# Altium project Mega2560_Custom.PrjPcb (part 4 of 4)

## Sheet SDCard-Sheet.SchDoc
size A4; DocumentNumber: 8; SheetNumber: 8; SheetTotal: 8
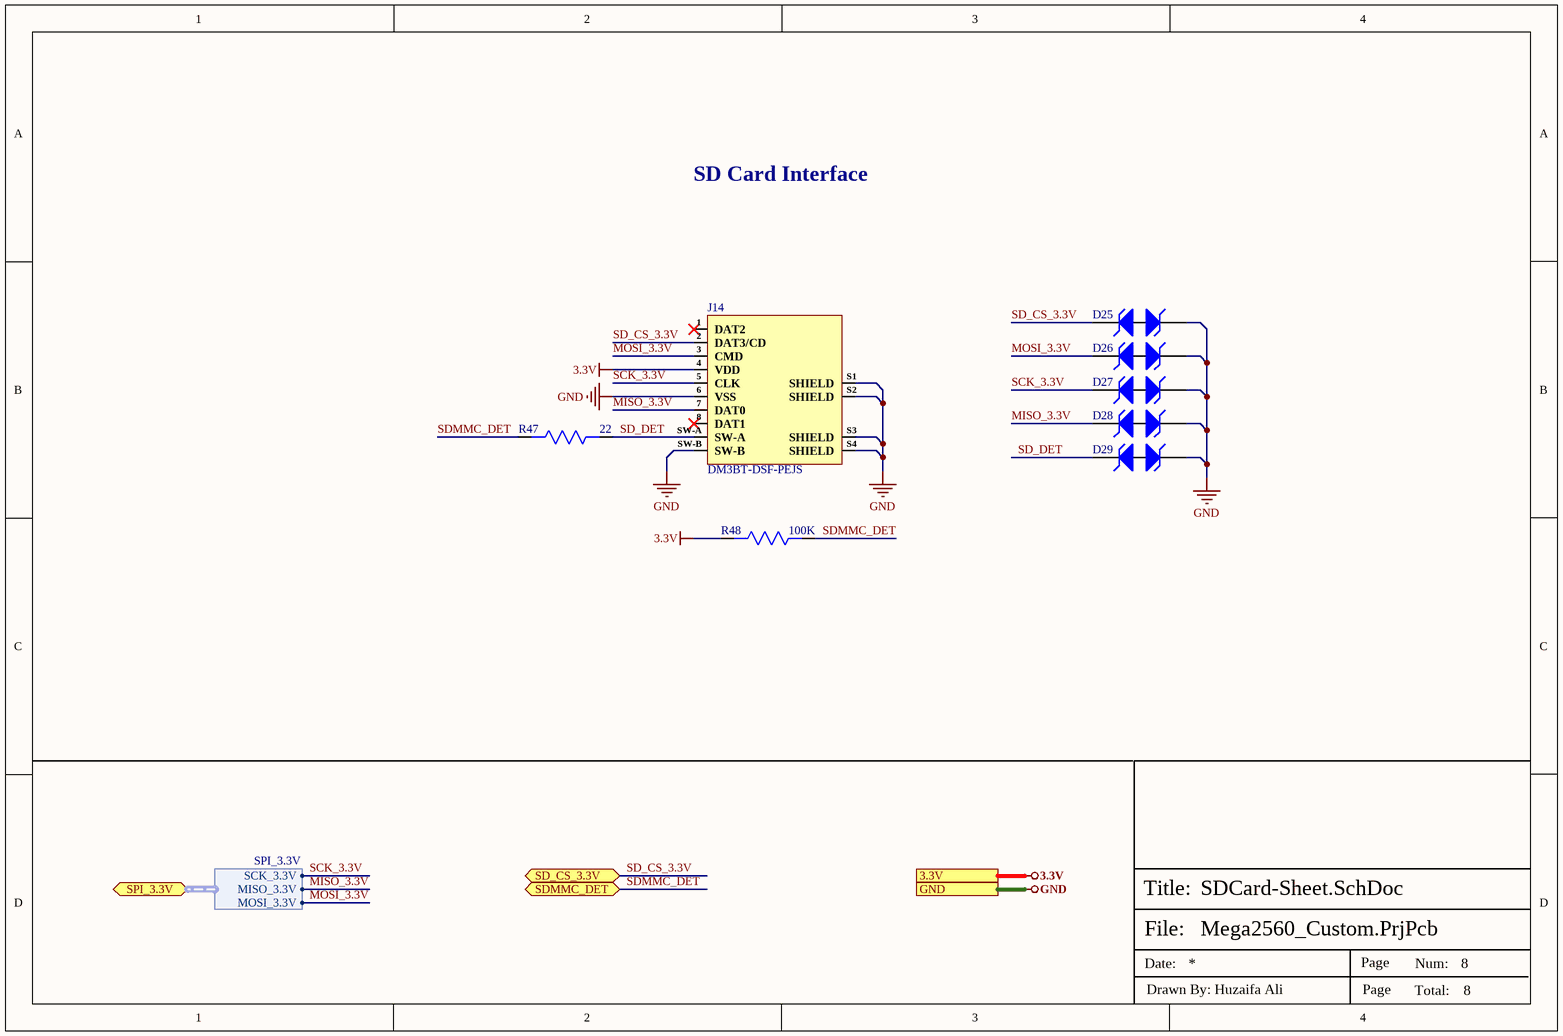
[diagram p6: SDCard-Sheet.SchDoc]

### Parts
D25  ESD5451N-2/TR  [DFN1006-2L_]  (value not drawn)
D26  ESD5451N-2/TR  [DFN1006-2L_]  (value not drawn)
D27  ESD5451N-2/TR  [DFN1006-2L_]  (value not drawn)
D28  ESD5451N-2/TR  [DFN1006-2L_]  (value not drawn)
D29  ESD5451N-2/TR  [DFN1006-2L_]  (value not drawn)
J14  DM3BT-DSF-PEJS  [DM3BT-DSF-PEJS]
R47  22  [Res-0402]
R48  100K  [Res-0402]

### Ports
3.3V, GND, SD_CS_3.3V (bidir), SDMMC_DET (bidir), SPI_3.3V (bidir, harness SPI_3.3V)

### Harnesses
SPI_3.3V: SCK_3.3V, MISO_3.3V, MOSI_3.3V

### Nets
3.3V: J14.4(VDD) R48.2 ; port 3.3V
GND: D25.2(k) D26.2(k) D27.2(k) D28.2(k) D29.2(k) J14.6(VSS) J14.S1(SHIELD) J14.S2(SHIELD) J14.S3(SHIELD) J14.S4(SHIELD) J14.SW-B ; port GND
MISO_3.3V: D28.1(K) J14.7(DAT0) ; port SPI_3.3V.MISO_3.3V
MOSI_3.3V: D26.1(K) J14.3(CMD) ; port SPI_3.3V.MOSI_3.3V
SCK_3.3V: D27.1(K) J14.5(CLK) ; port SPI_3.3V.SCK_3.3V
SD_CS_3.3V: D25.1(K) J14.2(DAT3/CD) ; port SD_CS_3.3V
SD_DET: D29.1(K) J14.SW-A R47.1
SDMMC_DET: R47.2 R48.1 ; port SDMMC_DET

Not connected (* = marked no-connect by the designer): J14 1(DAT2)* 8(DAT1)*

### Notes on the sheet
- SD Card Interface
- File:
- Title:
- Date:
- Page
- Num:
- Total:
- Drawn By: Huzaifa Ali

### Library data of the parts
D25-D29 = ESD5451N-2/TR: DFN1006-2L ESD Protection Devices ROHS; Manufacturer: WILLSEMI; ComponentLink1Description: LCSC; ComponentLink1URL: https://www.lcsc.com/product-detail/TVS_Will-Semicon-ESD5451N-2-TR_C239604.html; Manufacturer Part Number: ESD5451N-2/TR; Footprint: DFN1006-2L; LCSC Part Number: C239604
J14 = DM3BT-DSF-PEJS: CONN MICRO SD CARD PUSH-PUSH R/A; Manufacturer: Hirose; Max Current Rating: 500mA; Contact Resistance: 100mR; Voltage Rating (AC): 125V; Gender: Female; Number of Contacts: 8; Connector Type: Connector,Socket; Insulation Resistance: 1GR; Pitch: 1.1mm; Item Type: SD Card Connector; Supplier 1: Future Electronics; Manufacturer Part Number: DM3BT-DSF-PEJS; RoHS: Yes; Category: Memory Connectors; Stock 1: 9600; Pricing 1: 1200=1.39000 (USD); Mount: Surface Mount,Reverse; Contact Material: Copper Alloy,Copper; Contact Plating: Gold; Housing Material: Polymer; Min Operating Temperature: -25°C; Max Operating Temperature: 85°C; Number of Rows: 1; Packaging: Tape and Reel; Current Rating: 500mA; Package Quantity: 1; Termination: Solder; Max Voltage Rating (AC): 125V; Number of Positions: 8; Orientation: Right Angle; Series: DM3; Length: 13.85mm; Width: 16.05mm; Depth: 1.83mm; Radiation Hardening: No; Reach SVHC Compliant: Yes; Lead Free: Lead Free; Flammability Rating: UL94 V-0; RoHS Compliant: Yes; ComponentLink1URL: https://datasheet.ciiva.com/683/doc-1806131255093-683387.pdf?src-supplier=Digi-Key; ComponentLink1Description: https://datasheet.ciiva.com/683/doc-1806131255093-683387.pdf?src-supplier=Digi-Key; Supplier Part Number 1: 3000978; LCSC Part Number: C597972
R47 = RC0402FR-0722RL: RES 22 OHM 1% 1/16W 0402; Manufacturer: Yageo; Voltage Rating: 50V; Resistance: 22R; Power Rating: 62.5mW; Temperature Coefficient: 100ppm/°C; Max Power Dissipation: 63mW; Supplier 1: Digi-Key; Manufacturer Part Number: RC0402FR-0722RL; RoHS: Yes; Category: Chip SMD Resistors; Stock 1: 7045379; Pricing 1: 1=0.10000, 10=0.01400, 100=0.00580, 1000=0.00262, 2500=0.00228, 5000=0.00188 (USD); Case/Package: 0402; Number of Pins: 2; Case Code (Imperial): 0402; Case Code (Metric): 1005; Size Code: 0402; Min Operating Temperature: -55°C; Max Operating Temperature: 155°C; Resistor Type: Thick Film; Voltage Rating (DC): 50V; Tolerance: 1%; Packaging: Tape and Reel; Termination: SMD/SMT; Features: Moisture Resistant; Series: RC; Number of Terminations: 2; Resistance Tolerance: 1%; Technology: THICK FILM; Construction: Rectangular; Length: 1mm; Width: 0.5mm; Height: 0.32mm; Depth: 0.5mm; RoHS Compliant: Yes; Reach SVHC Compliant: Yes; Military Standard: Not; Lead Free: Lead Free; ComponentLink1URL: https://datasheet.ciiva.com/11819/0900766b80c66297-11819462.pdf?src-supplier=RSComponents; ComponentLink1Description: https://datasheet.ciiva.com/11819/0900766b80c66297-11819462.pdf?src-supplier=RSComponents; ComponentLink2URL: https://datasheet.ciiva.com/7849/1018594-7849912.pdf?src-supplier=Element14; ComponentLink2Description: https://datasheet.ciiva.com/7849/1018594-7849912.pdf?src-supplier=Element14; ComponentLink3URL: https://datasheet.ciiva.com/7849/1018594-7849911.pdf?src-supplier=Element14; ComponentLink3Description: https://datasheet.ciiva.com/7849/1018594-7849911.pdf?src-supplier=Element14; ComponentLink4URL: https://datasheet.ciiva.com/16930/pyu-rc0402-51-rohs-l-6-r-16930687.pdf?src-supplier=Future+Electronics; ComponentLink4Description: https://datasheet.ciiva.com/16930/pyu-rc0402-51-rohs-l-6-r-16930687.pdf?src-supplier=Future+Electronics; ComponentLink5URL: https://datasheet.ciiva.com/26829/getdatasheetpartid-554995-26829991.pdf?src-supplier=Verical; ComponentLink5Description: https://datasheet.ciiva.com/26829/getdatasheetpartid-554995-26829991.pdf?src-supplier=Verical; Supplier Part Number 1: 311-22.0LRCT-ND
R48 = RC0402FR-07100KL: RES 100K OHM 1% 1/16W 0402; Manufacturer: Yageo; Resistance: 100kR; Temperature Coefficient: 100ppm/°C; Power Rating: 63mW; Voltage Rating: 50V; Supplier 1: Mouser; Manufacturer Part Number: RC0402FR-07100KL; RoHS: Yes; Category: Chip SMD Resistors; Stock 1: 7759549; Pricing 1: 1=0.10000, 10=0.01200, 50=0.01200, 100=0.00500, 1000=0.00300, 2500=0.00200, 10000=0.00100 (USD); Case/Package: 0402; Case Code (Metric): 1005; Case Code (Imperial): 0402; Min Operating Temperature: -55°C; Max Operating Temperature: 155°C; Resistor Type: Thick Film; Tolerance: 1%; Packaging: Tape and Reel; Package Quantity: 1; Number of Terminations: 2; Termination: SMD/SMT; Max Power Dissipation: 63mW; Working Voltage: 50V; Features: Moisture Resistant; Series: RC; Resistance Tolerance: 1%; Construction: Rectangular; Technology: THICK FILM; Length: 0.039inch; Width: 0.02inch; Height: 0.016inch; Depth: 0.5mm; REACH SVHC: No SVHC; Lead Free: Lead Free; RoHS Compliant: Yes; Military Standard: Not; ComponentLink1URL: https://datasheet.ciiva.com/11819/0900766b80c66297-11819452.pdf?src-supplier=RSComponents; ComponentLink1Description: https://datasheet.ciiva.com/11819/0900766b80c66297-11819452.pdf?src-supplier=RSComponents; ComponentLink2URL: https://datasheet.ciiva.com/22747/1018594-22747509.pdf?src-supplier=Element14; ComponentLink2Description: https://datasheet.ciiva.com/22747/1018594-22747509.pdf?src-supplier=Element14; ComponentLink3URL: https://datasheet.ciiva.com/2453/pyu-r-int-thick-7-2453362.pdf?src-supplier=Digi-Key; ComponentLink3Description: https://datasheet.ciiva.com/2453/pyu-r-int-thick-7-2453362.pdf?src-supplier=Digi-Key; ComponentLink4URL: https://datasheet.ciiva.com/2453/pyu-r-int-thick-7-2453363.pdf?src-supplier=Digi-Key; ComponentLink4Description: https://datasheet.ciiva.com/2453/pyu-r-int-thick-7-2453363.pdf?src-supplier=Digi-Key; ComponentLink5URL: https://datasheet.ciiva.com/2453/pyu-r-int-thick-7-2453361.pdf?src-supplier=Digi-Key; ComponentLink5Description: https://datasheet.ciiva.com/2453/pyu-r-int-thick-7-2453361.pdf?src-supplier=Digi-Key; ComponentLink6URL: https://datasheet.ciiva.com/12667/pyu-rc0402-51-rohs-l-6-r-12667930.pdf?src-supplier=Mouser; ComponentLink6Description: https://datasheet.ciiva.com/12667/pyu-rc0402-51-rohs-l-6-r-12667930.pdf?src-supplier=Mouser; ComponentLink7URL: https://datasheet.ciiva.com/15189/getdatasheetpartid-323696-15189334.pdf?src-supplier=Verical; ComponentLink7Description: https://datasheet.ciiva.com/15189/getdatasheetpartid-323696-15189334.pdf?src-supplier=Verical; Supplier Part Number 1: 603-RC0402FR-07100KL

## Sheet Controller-Sheet.SchDoc
size A4; DocumentNumber: 6; SheetNumber: 6; SheetTotal: 8
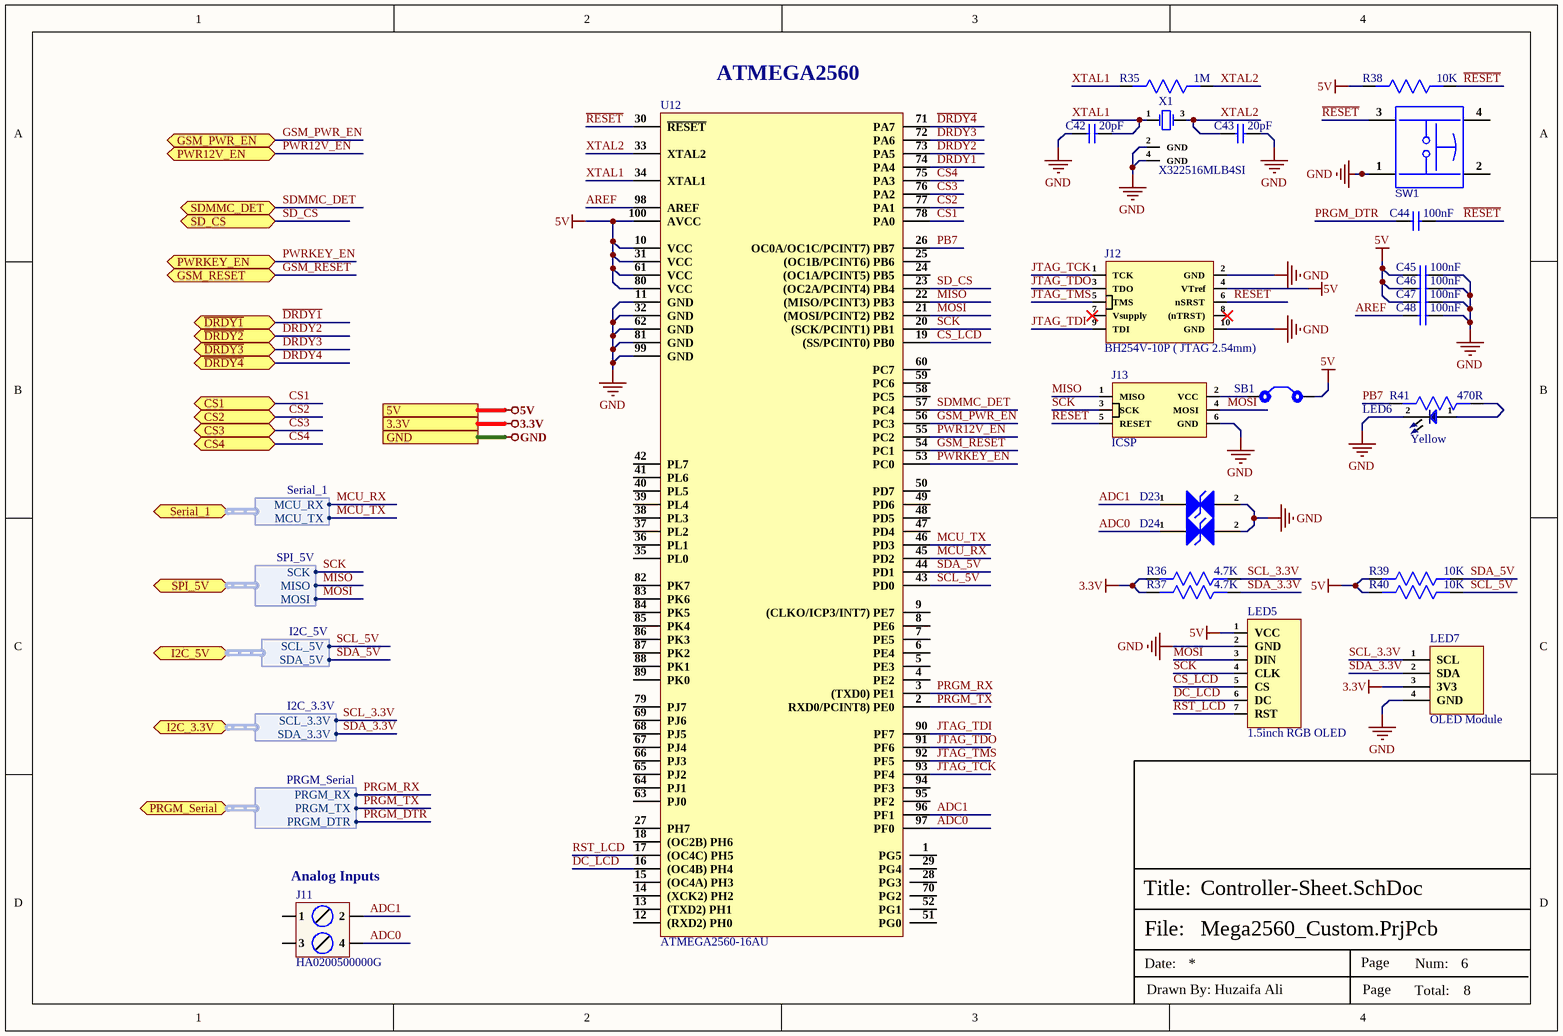
[diagram p7: Controller-Sheet.SchDoc]

### Parts
C42  20pF  [Cap-0603]
C43  20pF  [Cap-0603]
C44  100nF  [Cap-0603]
C45  100nF  [Cap-0603]
C46  100nF  [Cap-0603]
C47  100nF  [Cap-0603]
C48  100nF  [Cap-0603]
D23  PESD5V0H1BSFYL  [DSN0603-2]  (value not drawn)
D24  PESD5V0H1BSFYL  [DSN0603-2]  (value not drawn)
J11  HA0200500000G  [HA0200500000G]
J12  BH254V-10P ( JTAG 2.54mm)  [BH254V-10P]
J13  ICSP  [BH254V-6P]
LED5  1.5inch RGB OLED  [1.5inch RGB OLED]
LED6  Yellow  [LED-0603]
LED7  OLED Module  [ZIO-101954]
R35  1M  [Res-0603]
R36  4.7K  [Res-0603]
R37  4.7K  [Res-0603]
R38  10K  [Res-0603]
R39  10K  [Res-0603]
R40  10K  [Res-0603]
R41  470R  [Res-0603]
SB1  Solder Bridge  [Solder Bridge]  (value not drawn)
SW1  Tactile Switch  [TL3301NF160QG]  (value not drawn)
U12  ATMEGA2560-16AU  [TQFP-100(14x14)]
X1  X322516MLB4SI  [SMD3225-4P]

### Ports
3.3V, 5V, CS1 (bidir), CS2 (bidir), CS3 (bidir), CS4 (bidir), GND, GSM_PWR_EN (bidir), GSM_RESET (bidir), I2C_3.3V (bidir, harness I2C_3.3V), I2C_5V (bidir, harness I2C_5V), PRGM_Serial (bidir, harness PRGM_Serial), PWR12V_EN (bidir), PWRKEY_EN (bidir), SD_CS (bidir), SDMMC_DET (bidir), Serial_1 (bidir, harness Serial_1), SPI_5V (bidir, harness SPI_5V), ~{DRDY1} (bidir), ~{DRDY2} (bidir), ~{DRDY3} (bidir), ~{DRDY4} (bidir)

### Harnesses
I2C_3.3V: SCL_3.3V, SDA_3.3V
I2C_5V: SCL_5V, SDA_5V
SPI_5V: SCK, MISO, MOSI
PRGM_Serial: PRGM_RX, PRGM_TX, PRGM_DTR
Serial_1: MCU_RX, MCU_TX

### Nets
3.3V: LED7.3(3V3) R36.2 R37.2 ; port 3.3V
5V: C45.1 C46.1 C47.1 J12.4(VTref) LED5.1(VCC) R38.2 R39.2 R40.2 SB1.2 U12.10(VCC) U12.31(VCC) U12.61(VCC) U12.80(VCC) U12.100(AVCC) ; port 5V
GND: C42.1 C43.2 C45.2 C46.2 C47.2 C48.2 D23.2 D24.2 J12.2(GND) J12.10(GND) J13.6(GND) LED5.2(GND) LED6.2 LED7.4(GND) SW1.1 U12.11(GND) U12.32(GND) U12.62(GND) U12.81(GND) U12.99(GND) X1.2(GND) X1.4(GND) ; port GND
ADC0: D24.1 J11.4 U12.97(PF0)
ADC1: D23.1 J11.2 U12.96(PF1)
AREF: C48.1 U12.98(AREF)
CS1: U12.78(PA0) ; port CS1
CS2: U12.77(PA1) ; port CS2
CS3: U12.76(PA2) ; port CS3
CS4: U12.75(PA3) ; port CS4
CS_LCD: LED5.5(CS) U12.19((SS/PCINT0)_PB0)
~{DRDY1}: U12.74(PA4) ; port ~{DRDY1}
~{DRDY2}: U12.73(PA5) ; port ~{DRDY2}
~{DRDY3}: U12.72(PA6) ; port ~{DRDY3}
~{DRDY4}: U12.71(PA7) ; port ~{DRDY4}
DC_LCD: LED5.6(DC) U12.16((OC4B)_PH4)
GSM_PWR_EN: U12.56(PC3) ; port GSM_PWR_EN
GSM_RESET: U12.54(PC1) ; port GSM_RESET
JTAG_TCK: J12.1(TCK) U12.93(PF4)
JTAG_TDI: J12.9(TDI) U12.90(PF7)
JTAG_TDO: J12.3(TDO) U12.91(PF6)
JTAG_TMS: J12.5(TMS) U12.92(PF5)
MCU_RX: U12.45(PD2) ; port Serial_1.MCU_RX
MCU_TX: U12.46(PD3) ; port Serial_1.MCU_TX
MISO: J13.1(MISO) U12.22((MISO/PCINT3)_PB3) ; port SPI_5V.MISO
MOSI: J13.4(MOSI) LED5.3(DIN) U12.21((MOSI/PCINT2)_PB2) ; port SPI_5V.MOSI
PB7: R41.2 U12.26(OC0A/OC1C/PCINT7)_PB7)
PRGM_DTR: C44.1 ; port PRGM_Serial.PRGM_DTR
PRGM_RX: U12.3((TXD0)_PE1) ; port PRGM_Serial.PRGM_RX
PRGM_TX: U12.2(RXD0/PCINT8)_PE0) ; port PRGM_Serial.PRGM_TX
PWR12V_EN: U12.55(PC2) ; port PWR12V_EN
PWRKEY_EN: U12.53(PC0) ; port PWRKEY_EN
~{RESET}: C44.2 J12.6(nSRST) J13.5(RESET) R38.1 SW1.3 U12.30(~{RESET})
RST_LCD: LED5.7(RST) U12.17((OC4C)_PH5)
SCK: J13.3(SCK) LED5.4(CLK) U12.20((SCK/PCINT1)_PB1) ; port SPI_5V.SCK
SCL_3.3V: LED7.1(SCL) R36.1 ; port I2C_3.3V.SCL_3.3V
SCL_5V: R40.1 U12.43(PD0) ; port I2C_5V.SCL_5V
SD_CS: U12.23((OC2A/PCINT4)_PB4) ; port SD_CS
SDA_3.3V: LED7.2(SDA) R37.1 ; port I2C_3.3V.SDA_3.3V
SDA_5V: R39.1 U12.44(PD1) ; port I2C_5V.SDA_5V
SDMMC_DET: U12.57(PC4) ; port SDMMC_DET
XTAL1: C42.2 R35.2 U12.34(XTAL1) X1.1(CRYSTAL)
XTAL2: C43.1 R35.1 U12.33(XTAL2) X1.3(CRYSTAL)
NetJ13_2: J13.2(VCC) SB1.1
NetLED6_1: LED6.1 R41.1

Not connected (* = marked no-connect by the designer): J11 1 3; J12 7(Vsupply)* 8((nTRST))*; SW1 2 4; U12 1(PG5) 4(PE2) 5(PE3) 6(PE4) 7(PE5) 8(PE6) 9((CLKO/ICP3/INT7)_PE7) 12((RXD2)_PH0) 13((TXD2)_PH1) 14((XCK2)_PH2) 15((OC4A)_PH3) 18((OC2B)_PH6) 24((OC1A/PCINT5)_PB5) 25((OC1B/PCINT6)_PB6) 27(PH7) 28(PG3) 29(PG4) 35(PL0) 36(PL1) 37(PL2) 38(PL3) 39(PL4) 40(PL5) 41(PL6) 42(PL7) 47(PD4) 48(PD5) 49(PD6) 50(PD7) 51(PG0) 52(PG1) 58(PC5) 59(PC6) 60(PC7) 63(PJ0) 64(PJ1) 65(PJ2) 66(PJ3) 67(PJ4) 68(PJ5) 69(PJ6) 70(PG2) 79(PJ7) 82(PK7) 83(PK6) 84(PK5) 85(PK4) 86(PK3) 87(PK2) 88(PK1) 89(PK0) 94(PF3) 95(PF2)

### Notes on the sheet
- (near U12) ATMEGA2560
- (near J11) Analog Inputs
- File:
- Title:
- Date:
- Page
- Num:
- Total:
- Drawn By: Huzaifa Ali

### Library data of the parts
C42 C43 = CC0603JRNPO9BN200: CAP CER 20PF 50V C0G/NPO 0603; Manufacturer: Yageo; Tolerance: 5%; Dielectric: C0G; Supplier 1: Digi-Key; Manufacturer Part Number: CC0603JRNPO9BN200; Stock 1: 259568; Pricing 1: 1=0.1, 10=0.048, 100=0.0214, 500=0.01526, 1000=0.01198 (USD); Mount: Surface Mount; Case/Package: 0603; Number of Pins: 2; Weight: 7.1E-05oz; Case Code (Imperial): 0603; Case Code (Metric): 1608; Min Operating Temperature: -55°C; Max Operating Temperature: 125°C; Capacitance: 20pF; Package Quantity: 4000; Voltage Rating (DC): 50V; Packaging: Tape and Reel; Voltage Rating: 50V; Termination: SMD/SMT; Composition: Ceramic; Length: 1.6mm; Width: 0.8mm; Thickness: 0.035inch; Depth: 0.8mm; REACH SVHC: Unknown; Lead Free: Lead Free; ComponentLink1URL: http://www.farnell.com/datasheets/1132289.pdf?src-supplier=Element14; ComponentLink1Description: http://www.farnell.com/datasheets/1132289.pdf?src-supplier=Element14; ComponentLink2URL: http://www.yageo.com/documents/recent/UPY-GP_NP0_16V-to-50V_16.pdf?src-supplier=Digi-Key; ComponentLink2Description: http://www.yageo.com/documents/recent/UPY-GP_NP0_16V-to-50V_16.pdf?src-supplier=Digi-Key; Supplier Part Number 1: 311-1424-6-ND; LCSC Part Number: C105621
C44-C48 = CC0603KRX5R9BB104: CAP CER 0.1UF 50V X5R 0603; Manufacturer: Yageo; Tolerance: 10%; Item Type: Capacitor; Supplier 1: Digi-Key; Manufacturer Part Number: CC0603KRX5R9BB104; RoHS: Yes; Category: Ceramic Capacitors; Stock 1: 152253; Pricing 1: 1=0.10000, 10=0.05200, 50=0.02820, 100=0.02310, 500=0.01648, 1000=0.01294 (USD); Mount: Surface Mount; Case/Package: 0603; Case Code (Imperial): 0603; Case Code (Metric): 1608; Weight: 7.1E-05oz; Min Operating Temperature: -55°C; Max Operating Temperature: 85°C; Capacitance: 100nF; Packaging: Tape and Reel; Voltage Rating: 50V; Dielectric: X5R; Termination: SMD/SMT; Voltage Rating (DC): 50V; Package Quantity: 4000; Length: 0.063inch; Width: 0.031inch; Thickness: 0.035inch; Lead Free: Lead Free; Halogen Free: Halogen Free; ComponentLink1URL: http://www.mouser.com/ds/2/447/Yageo_UPY-GP_NP0_16V-to-50V_9-358835.pdf?src-supplier=Mouser; ComponentLink1Description: http://www.mouser.com/ds/2/447/Yageo_UPY-GP_NP0_16V-to-50V_9-358835.pdf?src-supplier=Mouser; ComponentLink2URL: https://www.yageo.com/upload/media/product/productsearch/datasheet/mlcc/UPY-GPHC_X5R_4V-to-50V_26.pdf?src-supplier=Digi-Key; ComponentLink2Description: https://www.yageo.com/upload/media/product/productsearch/datasheet/mlcc/UPY-GPHC_X5R_4V-to-50V_26.pdf?src-supplier=Digi-Key; ComponentLink3URL: http://www.yageo.com/exep/pages/download/literatures/ProductSelectionGuide%202014_Final_2.pdf?src-supplier=Digi-Key; ComponentLink3Description: http://www.yageo.com/exep/pages/download/literatures/ProductSelectionGuide%202014_Final_2.pdf?src-supplier=Digi-Key; Supplier Part Number 1: 311-4046-1-ND; LCSC Part Number: C110022
D23 D24 = PESD5V0H1BSFYL: TVS DIODE 5VWM 6.3VC DSN0603-2; Manufacturer: Nexperia; Supplier 1: Avnet; Manufacturer Part Number: PESD5V0H1BSFYL; RoHS: Yes; Category: ESD and Circuit Protection ICs; Stock 1: 9000; Pricing 1: 18000=0.06453, 36000=0.06278, 54000=0.06104, 90000=0.05930, 180000=0.05755, 900000=0.05581, 1800000=0.05406 (USD); RoHS Compliant: Yes; ComponentLink1URL: http://www.farnell.com/datasheets/1961312.pdf?src-supplier=Farnell; ComponentLink1Description: http://www.farnell.com/datasheets/1961312.pdf?src-supplier=Farnell; ComponentLink2URL: https://assets.nexperia.com/documents/data-sheet/PESD5V0H1BSF.pdf?src-supplier=Digi-Key; ComponentLink2Description: https://assets.nexperia.com/documents/data-sheet/PESD5V0H1BSF.pdf?src-supplier=Digi-Key; ComponentLink3URL: http://www.farnell.com/datasheets/1961312.pdf?src-supplier=Newark; ComponentLink3Description: http://www.farnell.com/datasheets/1961312.pdf?src-supplier=Newark; Supplier Part Number 1: PESD5V0H1BSFYL; LCSC Part Number: C477989; Item Type: Diode
J11 = HA0200500000G: TERM BLK 2POS TOP ENT 5.08MM PCB; Manufacturer: Amphenol; Item Type: Terminal Block; Supplier 1: Arrow Electronics; Manufacturer Part Number: HA0200500000G; RoHS: Yes; Stock 1: 120; Pricing 1: 2160=0.34600, 2520=0.34400, 3600=0.29460, 9000=0.29270, 18000=0.29070, 45000=0.28890, 90000=0.28680 (USD); Terminal and Terminal Block Type: BARRIER STRIP TERMINAL BLOCK; RoHS Compliant: Yes; Reach SVHC Compliant: Yes; ComponentLink1URL: https://datasheet.ciiva.com:443/pdfs/VipMasterIC/IC/AMPH/AMPH-S-A0005047712/AMPH-S-A0005047712-1.pdf?src-supplier=IHS+Markit; ComponentLink1Description: https://datasheet.ciiva.com:443/pdfs/VipMasterIC/IC/AMPH/AMPH-S-A0005047712/AMPH-S-A0005047712-1.pdf?src-supplier=IHS+Markit; Supplier Part Number 1: HA0200500000G; LCSC Part Number: C967080
J12 = BH254V-10P ( JTAG 2.54mm): 2.54mm -40℃~+105℃ Straight 3A 250V 5 Push - Pull 2.54mm 2 Plugin,P=2.54mm IDC Connectors ROHS; Manufacturer: XFCN; Manufacturer Part Number: BH254V-10P; Package: Plugin,P=2.54mm; LCSC Part Number: C492442; Item Type: Connector; ComponentLink1Description: LCSC; ComponentLink1URL: https://www.lcsc.com/product-detail/IDC-Connectors_XFCN-BH254V-10P_C492442.html
J13 = BH254V-6P ( 6-ICSP 2.54mm): 2.54mm -40℃~+105℃ Straight 3A 250V 3 Push - Pull 2.54mm 2 Plugin,P=2.54mm IDC Connectors ROHS; Manufacturer: XFCN; Manufacturer Part Number: BH254V-6P; Package: Plugin,P=2.54mm; LCSC Part Number: C492441; Item Type: Connector; ComponentLink1Description: LCSC; ComponentLink1URL: *https://www.lcsc.com/product-detail/IDC-Connectors_XFCN-BH254V-6P_C492441.html
LED5 = 1.5inch RGB OLED: 1.5inch (128×128) SPI RGB OLED Display Module; Manufacturer: Waveshare; Manufacturer Part Number: 1.5inch RGB OLED Module; Item Type: OLED Module; Package: Custom; LCSC Part Number: *; ComponentLink1Description: Waveshare; ComponentLink1URL: https://www.waveshare.com/product/ai/1.5inch-rgb-oled-module.htm
LED6 = 19-21/G6C-FM1N2B/3T: Yellow-Green 572nm LED Indication - Discrete 2.05V 0603 (1608 Metric); Manufacturer: Everlight Elec; Manufacturer Part Number: 19-21/G6C-FM1N2B/3T; Package: 0603; LCSC Part Number: C93689; Item Type: LED; ComponentLink1Description: LCSC; ComponentLink1URL: https://www.lcsc.com/product-detail/Light-Emitting-Diodes-LED_Everlight-Elec-19-21-G6C-FM1N2B-3T_C93689.html
LED7 = ZIO-101954: ZIO QWIIC 1.5INCH OLED DISPLAY; Manufacturer: Smart Prototyping; Manufacturer Part Number: ZIO-101954; Package: Custom; LCSC Part Number: *; Item Type: OLED Module; ComponentLink1Description: Digikey; ComponentLink1URL: https://www.digikey.com/en/products/detail/smart-prototyping/ZIO-101954/14565832
R35 = RC0603FR-071ML: RES SMD 1M OHM 1% 1/10W 0603; Manufacturer: Yageo; Voltage Rating: 50V; Resistance: 1MR; Power Rating: 100mW; Temperature Coefficient: 100ppm/°C; Supplier 1: Digi-Key; Manufacturer Part Number: RC0603FR-071ML; Stock 1: 3824601; Pricing 1: 1=0.1, 10=0.023, 100=0.0094, 1000=0.00421, 2500=0.00366 (USD); Case/Package: 0603; Number of Pins: 2; Case Code (Imperial): 0603; Case Code (Metric): 1608; Min Operating Temperature: -55°C; Max Operating Temperature: 155°C; Voltage Rating (DC): 50V; Tolerance: 1%; Packaging: Tape and Reel; Package Quantity: 5000; Termination: SMD/SMT; Composition: Thick Film; Military Standard: Not; Length: 1.6mm; Height: 0.45mm; Width: 0.8mm; Depth: 0.8mm; REACH SVHC: No SVHC; Lead Free: Lead Free; ComponentLink1URL: http://www.farnell.com/datasheets/2167052.pdf?src-supplier=Mouser; ComponentLink1Description: http://www.farnell.com/datasheets/2167052.pdf?src-supplier=Mouser; ComponentLink2URL: http://www.farnell.com/datasheets/2167052.pdf?src-supplier=Element14; ComponentLink2Description: http://www.farnell.com/datasheets/2167052.pdf?src-supplier=Element14; ComponentLink3URL: http://documents.rs-components.com/techlib://itc_doclist_GB.htm?stockno=5048956&src-supplier=RSComponents; ComponentLink3Description: http://documents.rs-components.com/techlib://itc_doclist_GB.htm?stockno=5048956&src-supplier=RSComponents; Supplier Part Number 1: 311-1.00MHRDKR-ND; LCSC Part Number: C105578
R36 R37 = RC0603JR-074K7L: RES SMD 4.7K OHM 5% 1/10W 0603; Manufacturer: Yageo; Resistance: 4.7kR; Temperature Coefficient: 100ppm/°C; Voltage Rating (DC): 50V; Power Rating: 100mW; Supplier 1: Digi-Key; Manufacturer Part Number: RC0603JR-074K7L; Stock 1: 19706643; Pricing 1: 1=0.1, 10=0.02, 100=0.0081, 1000=0.00362, 2500=0.00314 (USD); Case/Package: 0603; Number of Pins: 2; Case Code (Imperial): 0603; Case Code (Metric): 1608; Min Operating Temperature: -55°C; Max Operating Temperature: 155°C; Tolerance: 5%; Composition: Thick Film; Packaging: Tape and Reel; Voltage Rating: 50V; Termination: SMD/SMT; Military Standard: Not; Length: 1.6mm; Width: 0.8mm; Depth: 0.8mm; REACH SVHC: No SVHC; Lead Free: Lead Free; ComponentLink1URL: http://www.farnell.com/datasheets/443971.pdf?src-supplier=Element14; ComponentLink1Description: http://www.farnell.com/datasheets/443971.pdf?src-supplier=Element14; Supplier Part Number 1: 311-4.7KGRCT-ND; LCSC Part Number: C105428
R38-R40 = RC0603FR-0710KL: RES SMD 10K Ohm 1% 1/10W 0603; Manufacturer: Yageo; Resistance: 10kR; Temperature Coefficient: 100ppm/°C; Voltage Rating (DC): 50V; Power Rating: 100mW; Voltage Rating: 75V; Supplier 1: Digi-Key; Manufacturer Part Number: RC0603FR-0710KL; RoHS: Yes; Category: Chip SMD Resistors; Stock 1: 25249139; Pricing 1: 1=0.10000, 10=0.02400, 100=0.00970, 1000=0.00436, 2500=0.00378 (USD); Case/Package: 0603; Number of Pins: 2; Case Code (Imperial): 0603; Case Code (Metric): 1608; Weight: 7.1E-05oz; Size Code: 0603; Min Operating Temperature: -55°C; Max Operating Temperature: 155°C; Tolerance: 1%; Resistor Type: Thick Film; Packaging: Tape and Reel; Termination: SMD/SMT; Features: Moisture Resistant; Series: RC; Max Power Dissipation: 100mW; Number of Terminations: 2; Resistance Tolerance: 1%; Construction: Rectangular; Length: 1.6mm; Width: 0.8mm; Height: 0.45mm; Depth: 0.8mm; Lead Pitch: 0.3mm; REACH SVHC: Unknown; Lead Free: Lead Free; Military Standard: Not; RoHS Compliant: Yes; ComponentLink1URL: https://datasheet.ciiva.com/7660/38590-7660789.pdf?src-supplier=Element14; ComponentLink1Description: https://datasheet.ciiva.com/7660/38590-7660789.pdf?src-supplier=Element14; ComponentLink2URL: https://datasheet.ciiva.com/7983/443971-7983596.pdf?src-supplier=Element14; ComponentLink2Description: https://datasheet.ciiva.com/7983/443971-7983596.pdf?src-supplier=Element14; ComponentLink3URL: https://datasheet.ciiva.com/22747/443971-22747519.pdf?src-supplier=Element14; ComponentLink3Description: https://datasheet.ciiva.com/22747/443971-22747519.pdf?src-supplier=Element14; ComponentLink4URL: https://datasheet.ciiva.com/46440/1868787-46440891.pdf?src-supplier=Element14; ComponentLink4Description: https://datasheet.ciiva.com/46440/1868787-46440891.pdf?src-supplier=Element14; ComponentLink5URL: https://datasheet.ciiva.com/7746/1738695-7746239.pdf?src-supplier=Element14; ComponentLink5Description: https://datasheet.ciiva.com/7746/1738695-7746239.pdf?src-supplier=Element14; ComponentLink6URL: https://datasheet.ciiva.com/15189/getdatasheetpartid-409289-15189591.pdf?src-supplier=Verical; ComponentLink6Description: https://datasheet.ciiva.com/15189/getdatasheetpartid-409289-15189591.pdf?src-supplier=Verical; Supplier Part Number 1: 311-10.0KHRCT-ND; LCSC Part Number: C98220
R41 = RC0603FR-07470RL: RES 470 OHM 1% 1/10W 0603; Manufacturer: Yageo; Power Rating: 100mW; Voltage Rating: 50V; Temperature Coefficient: 100ppm/°C; Working Voltage: 75V; Supplier 1: Digi-Key; Manufacturer Part Number: RC0603FR-07470RL; RoHS: Yes; Category: Chip SMD Resistors; Stock 1: 154083; Pricing 1: 1=0.10000, 10=0.02400, 100=0.00970, 1000=0.00436, 2500=0.00378 (USD); Case/Package: 0603; Case Code (Metric): 1608; Case Code (Imperial): 0603; Min Operating Temperature: -55°C; Max Operating Temperature: 155°C; Tolerance: 1%; Resistance: 470R; Packaging: Tape and Reel; Package Quantity: 1; Resistor Type: Thick Film; Number of Terminations: 2; Termination: SMD/SMT; Max Power Dissipation: 100mW; Features: Moisture Resistant; Series: RC; Technology: THICK FILM; Resistance Tolerance: 1%; Construction: Rectangular; Length: 1.6mm; Width: 0.031inch; Height: 0.022inch; Depth: 0.8mm; RoHS Compliant: Yes; REACH SVHC: No SVHC; Military Standard: Not; Lead Free: Lead Free; ComponentLink1URL: https://datasheet.ciiva.com/11808/0900766b80f96399-11808177.pdf?src-supplier=RSComponents; ComponentLink1Description: https://datasheet.ciiva.com/11808/0900766b80f96399-11808177.pdf?src-supplier=RSComponents; ComponentLink2URL: https://datasheet.ciiva.com/7746/1738695-7746359.pdf?src-supplier=Element14; ComponentLink2Description: https://datasheet.ciiva.com/7746/1738695-7746359.pdf?src-supplier=Element14; ComponentLink3URL: https://datasheet.ciiva.com/7746/1738695-7746360.pdf?src-supplier=Element14; ComponentLink3Description: https://datasheet.ciiva.com/7746/1738695-7746360.pdf?src-supplier=Element14; ComponentLink4URL: https://datasheet.ciiva.com/7660/1868787-7660793.pdf?src-supplier=Element14; ComponentLink4Description: https://datasheet.ciiva.com/7660/1868787-7660793.pdf?src-supplier=Element14; ComponentLink5URL: https://datasheet.ciiva.com/46440/1868787-46440907.pdf?src-supplier=Element14; ComponentLink5Description: https://datasheet.ciiva.com/46440/1868787-46440907.pdf?src-supplier=Element14; ComponentLink6URL: https://datasheet.ciiva.com/2454/pyu-r-int-thick-7-2454012.pdf?src-supplier=Digi-Key; ComponentLink6Description: https://datasheet.ciiva.com/2454/pyu-r-int-thick-7-2454012.pdf?src-supplier=Digi-Key; ComponentLink7URL: https://datasheet.ciiva.com/2454/pyu-r-int-thick-7-2454013.pdf?src-supplier=Digi-Key; ComponentLink7Description: https://datasheet.ciiva.com/2454/pyu-r-int-thick-7-2454013.pdf?src-supplier=Digi-Key; ComponentLink8URL: https://datasheet.ciiva.com/2454/pyu-r-int-thick-7-2454014.pdf?src-supplier=Digi-Key; ComponentLink8Description: https://datasheet.ciiva.com/2454/pyu-r-int-thick-7-2454014.pdf?src-supplier=Digi-Key; Supplier Part Number 1: 311-470HRCT-ND; LCSC Part Number: C114669
SB1 = Solder Bridge: Solder Bridge ON
SW1 = TL3301NF160QG: SWITCH TACTILE SPST-NO 0.05A 12V; Manufacturer: E-Switch; Manufacturer Part Number: TL3301NF160QG/TR; Value: Custom; Package: SMD (6.00mm x 6.00mm); LCSC Part Number: C273526; ComponentLink1Description: LCSC; ComponentLink1URL: https://www.lcsc.com/product-detail/Tactile-Switches_E-Switch-TL3301NF160QG_C273526.html
U12 = ATMEGA2560-16AU: IC MCU 8BIT 256KB FLASH 100TQFP; Manufacturer: Microchip; Number of Terminals/Pins: 100; Package Body Material: Plastic; Core Architecture: AVR; Frequency: 16MHz; Interface: I2C,SPI,UART,USART,EBI/EMI,2-Wire; Number of I/Os: 86; Oscillator Type: Internal; Data Bus Width: 8b; Peripherals: PWM,Brown-out Detect/Reset,POR,WDT; Min Supply Voltage: 4.5V; Max Supply Voltage: 5.5V; Number of PWM Channels: 12; Operating Supply Voltage: 5V; RAM Size: 8KB; Number of Timers/Counters: 6; Number of ADC Channels: 16; Number of SPI Channels: 1; Watchdog Timer: Yes; Access Time: 16us; Time @ Peak Reflow Temperature-Max (s): 40s; Supplier 1: Avnet; Manufacturer Part Number: ATMEGA2560-16AU; RoHS: Yes; Category: Uncategorized; Stock 1: 4; Pricing 1: 1=12.70000 (USD); Mount: Surface Mount; Case/Package: A; Number of Pins: 100; Package Code: TFQFP; Package Shape: Square; Terminal Finish: Tin; Min Operating Temperature: -40°C; Max Operating Temperature: 85°C; Series: AVR® ATmega; Package Quantity: 90; Packaging: Tray; Memory Size: 256KB; Memory Type: FLASH; Density: 256KB; Number of Programmable I/O: 86; Max Frequency: 16MHz; Number of I2C Channels: 1; Termination: SMD/SMT; Terminal Form: Gull Wing; JESD-30 Code: S-PQFP-G100; Surface Mount: Yes; Terminal Position: QUAD; Number of I/O Lines: 86; Moisture Sensitivity Level: 3; Technology: CMOS; Peak Reflow Temperature (Cel): 260°C; Length: 14.1mm; Width: 14.1mm; Height: 1.05mm; Radiation Hardening: No; Reach SVHC Compliant: Yes; Lead Free: Lead Free; RoHS Compliant: Yes; Temperature Grade: INDUSTRIAL; ComponentLink1URL: https://datasheet.ciiva.com/22651/1698622-22651116.pdf?src-supplier=Farnell; ComponentLink1Description: https://datasheet.ciiva.com/22651/1698622-22651116.pdf?src-supplier=Farnell; ComponentLink2URL: https://datasheet.ciiva.com/15122/getdatasheetpartid-134542-15122545.pdf?src-supplier=Verical; ComponentLink2Description: https://datasheet.ciiva.com/15122/getdatasheetpartid-134542-15122545.pdf?src-supplier=Verical; ComponentLink3URL: https://datasheet.ciiva.com/29119/154804-da-01-en-atmega2560-16au-tqfp-100-29119580.pdf?src-supplier=Conrad; ComponentLink3Description: https://datasheet.ciiva.com/29119/154804-da-01-en-atmega2560-16au-tqfp-100-29119580.pdf?src-supplier=Conrad; ComponentLink4URL: https://datasheet.ciiva.com/6640/atmel-2549-8-bit-avr-microcontroller-atmega640-1280-1281-2560-2561-summary-6640293.pdf?src-supplier=Digi-Key; ComponentLink4Description: https://datasheet.ciiva.com/6640/atmel-2549-8-bit-avr-microcontroller-atmega640-1280-1281-2560-2561-summary-6640293.pdf?src-supplier=Digi-Key; ComponentLink5URL: https://datasheet.ciiva.com/1162/33246-1162139.pdf?src-supplier=Farnell; ComponentLink5Description: https://datasheet.ciiva.com/1162/33246-1162139.pdf?src-supplier=Farnell; ComponentLink6URL: https://datasheet.ciiva.com/1157/1817551-1157521.pdf?src-supplier=Element14; ComponentLink6Description: https://datasheet.ciiva.com/1157/1817551-1157521.pdf?src-supplier=Element14; ComponentLink7URL: https://datasheet.ciiva.com/16936/70123980-16936268.pdf?src-supplier=Allied+Electronics; ComponentLink7Description: https://datasheet.ciiva.com/16936/70123980-16936268.pdf?src-supplier=Allied+Electronics; Supplier Part Number 1: 68T2776; LCSC Part Number: C22460; Item Type: IC
X1 = X322516MLB4SI: 16MHz SMD Crystal Resonator 9pF ±10ppm ±30ppm -40℃~+85℃ SMD3225-4P Crystals ROHS; Manufacturer: Yangxing Tech; Manufacturer Part Number: X322516MLB4SI; Package: SMD3225-4P; ComponentLink1Description: LCSC; ComponentLink1URL: https://www.lcsc.com/product-detail/Crystals_Yangxing-Tech-X322516MLB4SI_C13738.html; LCSC Part Number: C13738; Item Type: Crystal

## Nets that join several sheets
3.3V: Power-Sheet (5 pins), Thermocouple-Sheet (20 pins), Level-Shifter-Sheet (6 pins), SDCard-Sheet (J14.4 R48.2), Controller-Sheet (LED7.3 R36.2 R37.2)
5V: Power-Sheet (10 pins), Level-Shifter-Sheet (6 pins), Controller-Sheet (14 pins)
GND: Power-Sheet (43 pins), Thermocouple-Sheet (28 pins), Level-Shifter-Sheet (9 pins), GSM-Sheet (46 pins), USB-to-UART-Sheet (7 pins), SDCard-Sheet (11 pins), Controller-Sheet (22 pins)
GSM_PWR: Power-Sheet (5 pins), GSM-Sheet (10 pins)
USB_PRGM: Power-Sheet (F3.2 P3.1), USB-to-UART-Sheet (C49.1 C50.1 R42.2 U13.7)
USB_VBUS: Power-Sheet (F2.2 P2.1), GSM-Sheet (U11.24)
VDD_EXT: Level-Shifter-Sheet (C29.1 U8.3 U8.6), GSM-Sheet (C35.2 R24.1 U11.15)
CS1: Thermocouple-Sheet (D8.1), Controller-Sheet (U12.78)
CS2: Thermocouple-Sheet (D12.1), Controller-Sheet (U12.77)
CS3: Thermocouple-Sheet (D9.1), Controller-Sheet (U12.76)
CS4: Thermocouple-Sheet (D13.1), Controller-Sheet (U12.75)
~{DRDY1}: Thermocouple-Sheet (D10.1 R12.2), Controller-Sheet (U12.74)
~{DRDY2}: Thermocouple-Sheet (D14.1 R18.2), Controller-Sheet (U12.73)
~{DRDY3}: Thermocouple-Sheet (D11.1 R13.2), Controller-Sheet (U12.72)
~{DRDY4}: Thermocouple-Sheet (D15.1 R19.2), Controller-Sheet (U12.71)
GSM_PWR_EN: Power-Sheet (U2.5), Controller-Sheet (U12.56)
GSM_RESET: GSM-Sheet (R33.2), Controller-Sheet (U12.54)
GSM_RX: Level-Shifter-Sheet (U8.4), GSM-Sheet (U11.10)
GSM_TX: Level-Shifter-Sheet (U8.5), GSM-Sheet (U11.9)
GSM_USB.GSM_USB_D_N: Power-Sheet (D4.2 J2.2), GSM-Sheet (D17.1 U11.28)
GSM_USB.GSM_USB_D_P: Power-Sheet (D4.1 J2.3), GSM-Sheet (D18.1 U11.27)
MCU_RX: Level-Shifter-Sheet (U8.8), Controller-Sheet (U12.45)
MCU_TX: Level-Shifter-Sheet (U8.1), Controller-Sheet (U12.46)
MISO: Level-Shifter-Sheet (U10.12), Controller-Sheet (J13.1 U12.22)
MISO_3.3V: Thermocouple-Sheet (U4.11 U5.11 U6.11 U7.11), Level-Shifter-Sheet (U10.3), SDCard-Sheet (D28.1 J14.7)
MOSI: Level-Shifter-Sheet (U10.11), Controller-Sheet (J13.4 LED5.3 U12.21)
MOSI_3.3V: Thermocouple-Sheet (U4.12 U5.12 U6.12 U7.12), Level-Shifter-Sheet (U10.4), SDCard-Sheet (D26.1 J14.3)
PRGM_DTR: USB-to-UART-Sheet (U13.23), Controller-Sheet (C44.1)
PRGM_RX: USB-to-UART-Sheet (U13.20), Controller-Sheet (U12.3)
PRGM_TX: USB-to-UART-Sheet (U13.21), Controller-Sheet (U12.2)
PWR12V_EN: Power-Sheet (R3.2 U3.4), Controller-Sheet (U12.55)
PWRKEY_EN: GSM-Sheet (R31.2), Controller-Sheet (U12.53)
SCK: Level-Shifter-Sheet (U10.13), Controller-Sheet (J13.3 LED5.4 U12.20)
SCK_3.3V: Thermocouple-Sheet (U4.10 U5.10 U6.10 U7.10), Level-Shifter-Sheet (U10.2), SDCard-Sheet (D27.1 J14.5)
SCL_3.3V: Level-Shifter-Sheet (U9.5), Controller-Sheet (LED7.1 R36.1)
SCL_5V: Level-Shifter-Sheet (U9.8), Controller-Sheet (R40.1 U12.43)
SD_CS: Level-Shifter-Sheet (U10.10), Controller-Sheet (U12.23)
SD_CS_3.3V: Level-Shifter-Sheet (U10.5), SDCard-Sheet (D25.1 J14.2)
SDA_3.3V: Level-Shifter-Sheet (U9.4), Controller-Sheet (LED7.2 R37.1)
SDA_5V: Level-Shifter-Sheet (U9.1), Controller-Sheet (R39.1 U12.44)
SDMMC_DET: SDCard-Sheet (R47.2 R48.1), Controller-Sheet (U12.57)
USB_D_N: Power-Sheet (D5.2 J3.2), USB-to-UART-Sheet (U13.4)
USB_D_P: Power-Sheet (D5.1 J3.3), USB-to-UART-Sheet (U13.3)